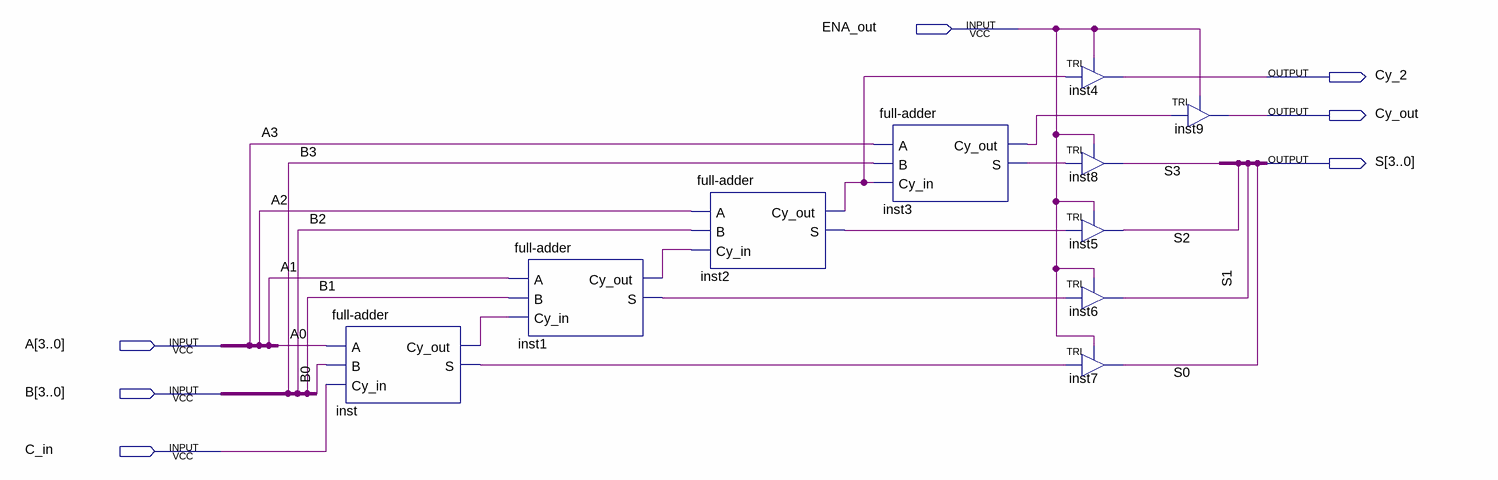
[diagram p0: schematic sheet]
// Quartus schematic sumador4.bdf as structural Verilog: 10 symbols, 7 pins
module sumador4 (
  input  ENA_out,
  input  [3:0] A,
  input  [3:0] B,
  input  C_in,
  output Cy_2,
  output Cy_out,
  output [3:0] S
);

  wire inst1_cy_out, inst1_s, inst2_cy_out, inst2_s, inst3_cy_out, inst3_s, inst_cy_out, inst_s;

  \full-adder  inst (.A(A[0]), .B(B[0]), .Cy_in(C_in), .Cy_out(inst_cy_out), .S(inst_s));
  \full-adder  inst1 (.A(A[1]), .B(B[1]), .Cy_in(inst_cy_out), .Cy_out(inst1_cy_out), .S(inst1_s));
  \full-adder  inst2 (.A(A[2]), .B(B[2]), .Cy_in(inst1_cy_out), .Cy_out(inst2_cy_out), .S(inst2_s));
  \full-adder  inst3 (.A(A[3]), .B(B[3]), .Cy_in(inst2_cy_out), .Cy_out(inst3_cy_out), .S(inst3_s));
  TRI inst4 (.IN(inst2_cy_out), .OE(ENA_out), .OUT(Cy_2));
  TRI inst8 (.IN(inst3_s), .OE(ENA_out), .OUT(S[3]));
  TRI inst5 (.IN(inst2_s), .OE(ENA_out), .OUT(S[2]));
  TRI inst6 (.IN(inst1_s), .OE(ENA_out), .OUT(S[1]));
  TRI inst7 (.IN(inst_s), .OE(ENA_out), .OUT(S[0]));
  TRI inst9 (.IN(inst3_cy_out), .OE(ENA_out), .OUT(Cy_out));
endmodule
